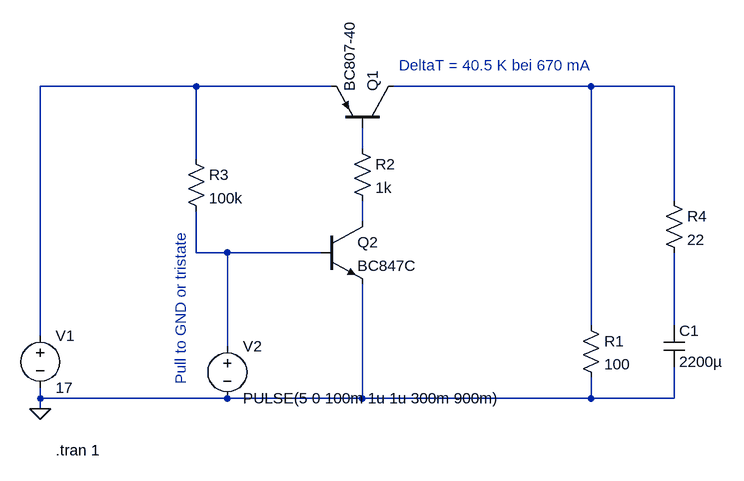
[diagram p0: schematic mosswitchA5.asc]
mosswitchA5.asc, the LTspice schematic file:
Version 4
SHEET 1 888 872
WIRE -240 -208 -480 -208
WIRE -32 -208 -240 -208
WIRE 368 -208 64 -208
WIRE 496 -208 368 -208
WIRE 16 -112 16 -144
WIRE -240 -96 -240 -208
WIRE 496 -32 496 -208
WIRE 16 0 16 -32
WIRE -240 48 -240 -16
WIRE -192 48 -240 48
WIRE -48 48 -192 48
WIRE 368 160 368 -208
WIRE 496 160 496 48
WIRE -480 176 -480 -208
WIRE -192 192 -192 48
WIRE -480 272 -480 256
WIRE -192 272 -480 272
WIRE 16 272 16 96
WIRE 16 272 -192 272
WIRE 368 272 368 240
WIRE 368 272 16 272
WIRE 496 272 496 224
WIRE 496 272 368 272
WIRE -480 288 -480 272
FLAG -480 288 0
SYMBOL voltage -480 160 R0
WINDOW 123 0 0 Left 0
WINDOW 39 0 0 Left 0
SYMATTR InstName V1
SYMATTR Value 17
SYMBOL res 352 144 R0
SYMATTR InstName R1
SYMATTR Value 100
SYMBOL pnp 64 -144 M270
SYMATTR InstName Q1
SYMATTR Value BC807-40
SYMBOL npn -48 0 R0
SYMATTR InstName Q2
SYMATTR Value BC847C
SYMBOL res 0 -128 R0
SYMATTR InstName R2
SYMATTR Value 1k
SYMBOL res -256 -112 R0
SYMATTR InstName R3
SYMATTR Value 100k
SYMBOL voltage -192 176 R0
WINDOW 123 0 0 Left 0
WINDOW 39 0 0 Left 0
SYMATTR InstName V2
SYMATTR Value PULSE(5 0 100m 1u 1u 300m 900m)
SYMBOL cap 480 160 R0
SYMATTR InstName C1
SYMATTR Value 2200µ
SYMBOL res 480 -48 R0
SYMATTR InstName R4
SYMATTR Value 22
TEXT -456 352 Left 2 !.tran 1
TEXT -264 16 VRight 2 ;Pull to GND or tristate
TEXT 72 -240 Left 2 ;DeltaT = 40.5 K bei 670 mA

The netlist it stands for:
* mosswitchA5.asc
V1 N001 0 17
R1 N002 0 100
Q1 N002 N003 N001 0 BC807-40
Q2 N004 N005 0 0 BC847C
R2 N003 N004 1k
R3 N001 N005 100k
V2 N005 0 PULSE(5 0 100m 1u 1u 300m 900m)
C1 N006 0 2200µ
R4 N002 N006 22
.model NPN NPN
.model PNP PNP
.lib standard.bjt
.tran 1
* Pull to GND or tristate
* DeltaT = 40.5 K bei 670 mA
.backanno
.end